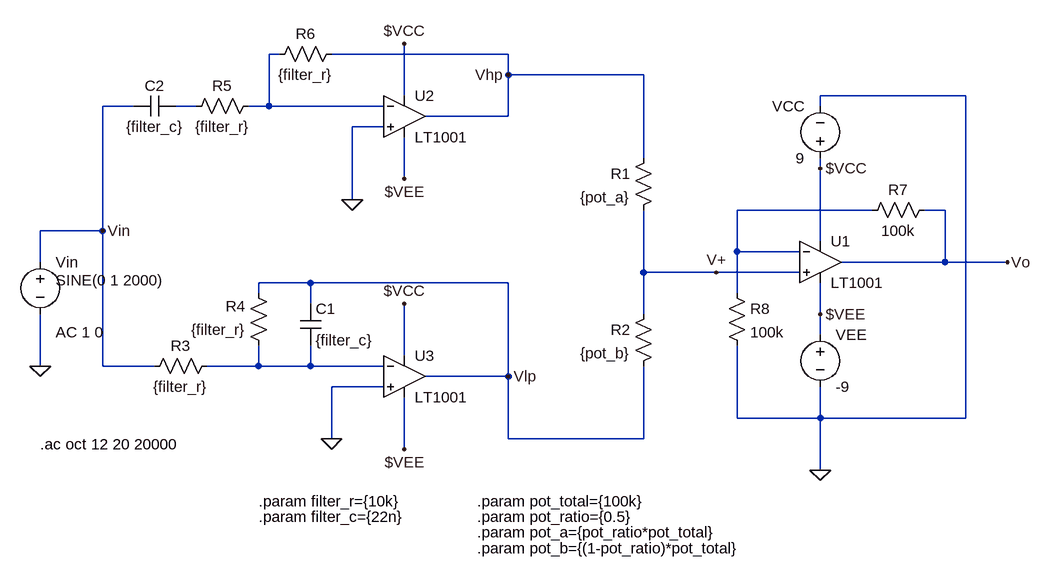
[diagram p0: schematic tone_control.asc]
tone_control.asc, the LTspice schematic file:
Version 4
SHEET 1 880 688
WIRE -384 -112 -400 -112
WIRE -32 -112 -304 -112
WIRE -32 -80 -32 -112
WIRE 176 -80 -32 -80
WIRE -192 -48 -192 -128
WIRE 672 -48 448 -48
WIRE -608 -32 -656 -32
WIRE -512 -32 -544 -32
WIRE -400 -32 -400 -112
WIRE -400 -32 -432 -32
WIRE -224 -32 -400 -32
WIRE 448 -32 448 -48
WIRE -32 -16 -32 -80
WIRE -32 -16 -160 -16
WIRE -224 0 -272 0
WIRE 176 48 176 -80
WIRE 448 64 448 48
WIRE -192 80 -192 16
WIRE -272 112 -272 0
WIRE 528 128 320 128
WIRE 640 128 608 128
WIRE -656 160 -656 -32
WIRE -656 160 -752 160
WIRE 448 176 448 64
WIRE 320 192 320 128
WIRE 416 192 320 192
WIRE -752 208 -752 160
WIRE 640 208 640 128
WIRE 640 208 480 208
WIRE 736 208 640 208
WIRE 176 224 176 128
WIRE 288 224 176 224
WIRE 416 224 288 224
WIRE -336 240 -416 240
WIRE -32 240 -336 240
WIRE -416 256 -416 240
WIRE 320 256 320 192
WIRE -336 272 -336 240
WIRE 176 288 176 224
WIRE 448 288 448 240
WIRE 448 320 448 288
WIRE -192 352 -192 272
WIRE -752 368 -752 288
WIRE -656 368 -656 160
WIRE -576 368 -656 368
WIRE -416 368 -416 336
WIRE -416 368 -496 368
WIRE -336 368 -336 336
WIRE -336 368 -416 368
WIRE -224 368 -336 368
WIRE -32 384 -32 240
WIRE -32 384 -160 384
WIRE -224 400 -304 400
WIRE 320 448 320 336
WIRE 448 448 448 400
WIRE 448 448 320 448
WIRE 672 448 672 -48
WIRE 672 448 448 448
WIRE -304 480 -304 400
WIRE -32 480 -32 384
WIRE 176 480 176 368
WIRE 176 480 -32 480
WIRE -192 496 -192 416
WIRE 448 528 448 448
FLAG 448 528 0
FLAG 736 208 Vo
FLAG 288 224 V+
FLAG 448 64 $VCC
FLAG 448 288 $VEE
FLAG -192 -128 $VCC
FLAG -192 272 $VCC
FLAG -192 80 $VEE
FLAG -192 496 $VEE
FLAG -304 480 0
FLAG -752 368 0
FLAG -272 112 0
FLAG -32 384 Vlp
FLAG -32 -80 Vhp
FLAG -656 160 Vin
SYMBOL OpAmps\\LT1001 448 144 R0
SYMATTR InstName U1
SYMBOL voltage 448 64 R180
WINDOW 0 24 96 Left 2
WINDOW 3 24 16 Left 2
WINDOW 123 0 0 Left 0
WINDOW 39 0 0 Left 0
SYMATTR InstName VCC
SYMATTR Value 9
SYMBOL voltage 448 304 R0
WINDOW 123 0 0 Left 0
WINDOW 39 0 0 Left 0
SYMATTR InstName VEE
SYMATTR Value -9
SYMBOL res 192 32 M0
SYMATTR InstName R1
SYMATTR Value {pot_a}
SYMBOL res 192 272 M0
SYMATTR InstName R2
SYMATTR Value {pot_b}
SYMBOL OpAmps\\LT1001 -192 -80 R0
SYMATTR InstName U2
SYMBOL OpAmps\\LT1001 -192 320 R0
SYMATTR InstName U3
SYMBOL res -480 352 R90
WINDOW 0 0 56 VBottom 2
WINDOW 3 32 56 VTop 2
SYMATTR InstName R3
SYMATTR Value {filter_r}
SYMBOL res -400 352 R180
WINDOW 0 36 76 Left 2
WINDOW 3 36 40 Left 2
SYMATTR InstName R4
SYMATTR Value {filter_r}
SYMBOL cap -352 272 R0
SYMATTR InstName C1
SYMATTR Value {filter_c}
SYMBOL res -416 -48 R90
WINDOW 0 0 56 VBottom 2
WINDOW 3 32 56 VTop 2
SYMATTR InstName R5
SYMATTR Value {filter_r}
SYMBOL cap -544 -48 R90
WINDOW 0 0 32 VBottom 2
WINDOW 3 32 32 VTop 2
SYMATTR InstName C2
SYMATTR Value {filter_c}
SYMBOL voltage -752 192 R0
WINDOW 123 24 124 Left 2
WINDOW 39 0 0 Left 0
WINDOW 3 24 44 Left 2
SYMATTR Value2 AC 1 0
SYMATTR Value SINE(0 1 2000)
SYMATTR InstName Vin
SYMBOL res -288 -128 R90
WINDOW 0 0 56 VBottom 2
WINDOW 3 32 56 VTop 2
SYMATTR InstName R6
SYMATTR Value {filter_r}
SYMBOL res 624 112 R90
WINDOW 0 0 56 VBottom 2
WINDOW 3 32 56 VTop 2
SYMATTR InstName R7
SYMATTR Value 100k
SYMBOL res 304 240 R0
SYMATTR InstName R8
SYMATTR Value 100k
TEXT -80 576 Left 2 !.param pot_total={100k}
TEXT -80 600 Left 2 !.param pot_ratio={0.5}
TEXT -80 624 Left 2 !.param pot_a={pot_ratio*pot_total}
TEXT -80 648 Left 2 !.param pot_b={(1-pot_ratio)*pot_total}
TEXT -752 488 Left 2 !.ac oct 12 20 20000
TEXT -416 576 Left 2 !.param filter_r={10k}
TEXT -416 600 Left 2 !.param filter_c={22n}

The netlist it stands for:
* tone_control.asc
XU1 V+ N003 $VCC $VEE Vo LT1001  ; pins In+ In- V+ V- OUT
VCC $VCC 0 9
VEE $VEE 0 -9
R1 Vhp V+ {pot_a}
R2 V+ Vlp {pot_b}
XU2 0 N001 $VCC $VEE Vhp LT1001  ; pins In+ In- V+ V- OUT
XU3 0 N004 $VCC $VEE Vlp LT1001  ; pins In+ In- V+ V- OUT
R3 N004 Vin {filter_r}
R4 N004 Vlp {filter_r}
C1 Vlp N004 {filter_c}
R5 N001 N002 {filter_r}
C2 N002 Vin {filter_c}
Vin Vin 0 SINE(0 1 2000) AC 1 0
R6 Vhp N001 {filter_r}
R7 Vo N003 100k
R8 N003 0 100k
.param pot_total={100k}
.param pot_ratio={0.5}
.param pot_a={pot_ratio*pot_total}
.param pot_b={(1-pot_ratio)*pot_total}
.ac oct 12 20 20000
.param filter_r={10k}
.param filter_c={22n}
.lib LTC.lib
.backanno
.end